# Altium project HeartRate_SpO2_Monitor.PrjPcb
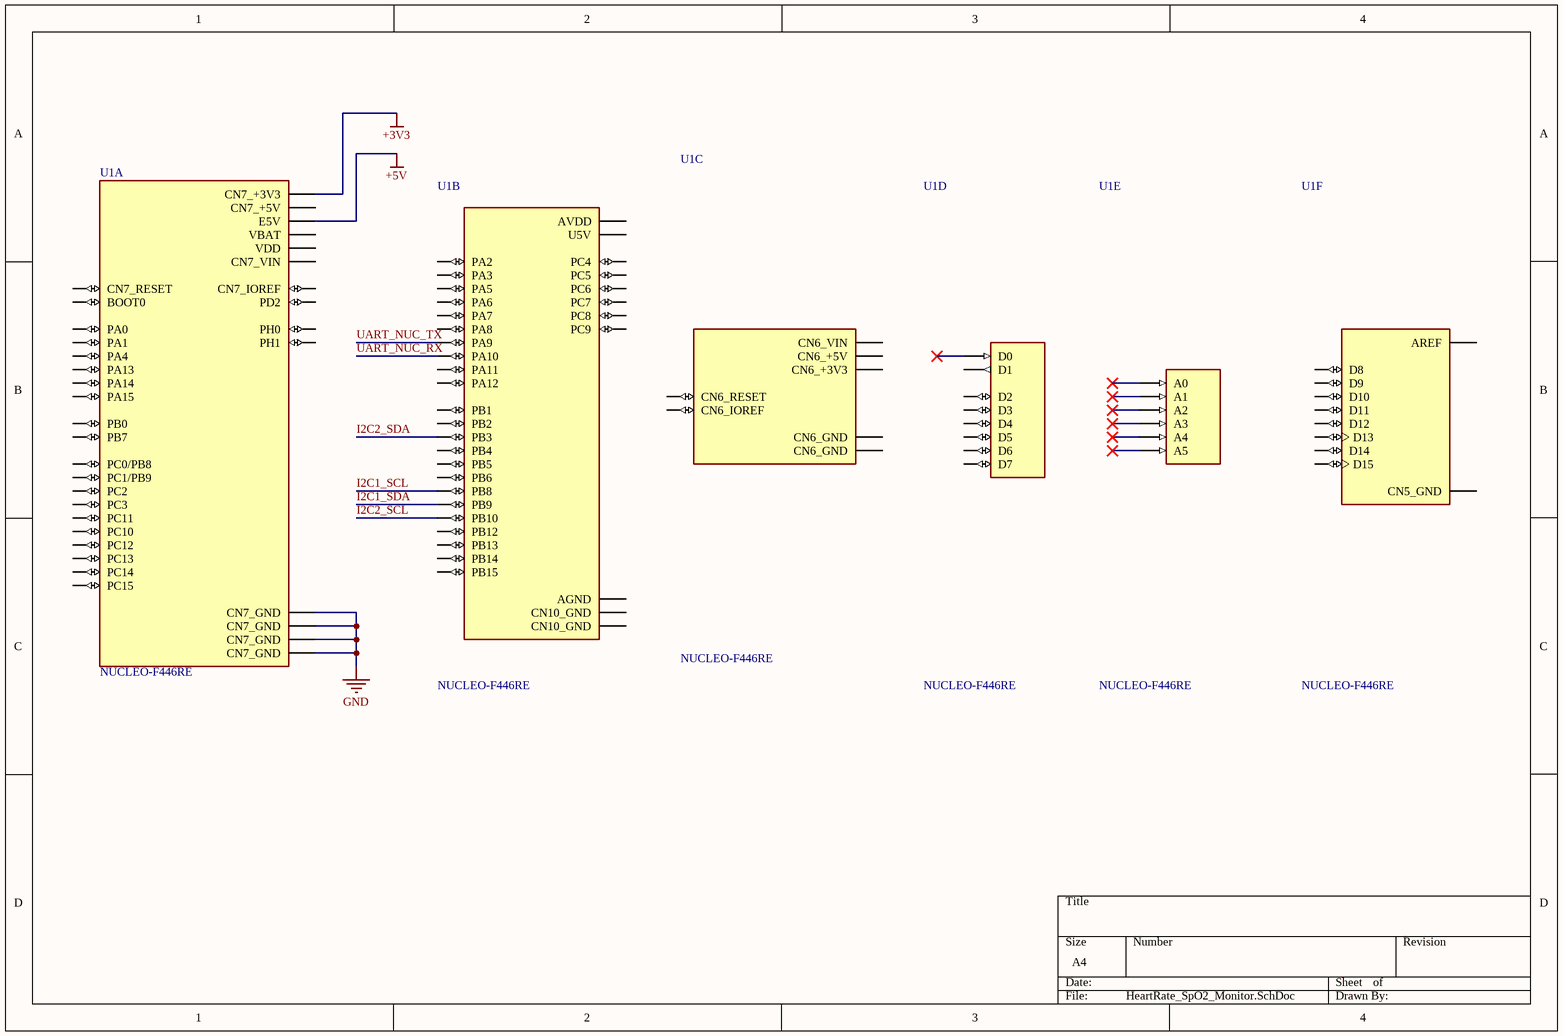
[diagram p0: HeartRate_SpO2_Monitor.SchDoc]
3 sheets, 21 parts. Net scope: global (net labels, ports and power ports of the same name join across sheets).
Board file: Pulsometro.PcbDoc
Sheets:
  HeartRate_SpO2_Monitor.SchDoc
  Alimentacion_Modulos.SchDoc
  Power.SchDoc

## Sheet HeartRate_SpO2_Monitor.SchDoc
size A4; SheetNumber: 1; SheetTotal: 2

### Parts
U1  NUCLEO-F446RE  [MODULE_NUCLEO-F446RE]  (parts A,B,C,D,E,F of 6)

### Nets
+3V3: U1.CN7_16(CN7_+3V3)
+5V: U1.CN7_6(E5V)
GND: U1.CN7_8(CN7_GND) U1.CN7_19(CN7_GND) U1.CN7_20(CN7_GND) U1.CN7_22(CN7_GND)
I2C1_SCL: U1.CN10_3(PB8)
I2C1_SDA: U1.CN10_5(PB9)
I2C2_SCL: U1.CN10_25(PB10)
I2C2_SDA: U1.CN10_31(PB3)
UART_NUC_RX: U1.CN10_33(PA10)
UART_NUC_TX: U1.CN10_21(PA9)

Not connected (* = marked no-connect by the designer): U1 CN5_1(D8) CN5_2(D9) CN5_3(D10) CN5_4(D11) CN5_5(D12) CN5_6(D13) CN5_7(CN5_GND) CN5_8(AREF) CN5_9(D14) CN5_10(D15) CN6_2(CN6_IOREF) CN6_3(CN6_RESET) CN6_4(CN6_+3V3) CN6_5(CN6_+5V) CN6_6(CN6_GND) CN6_7(CN6_GND) CN6_8(CN6_VIN) CN7_1(PC10) CN7_2(PC11) CN7_3(PC12) CN7_4(PD2) CN7_5(VDD) CN7_7(BOOT0) CN7_12(CN7_IOREF) CN7_13(PA13) CN7_14(CN7_RESET) CN7_15(PA14) CN7_17(PA15) CN7_18(CN7_+5V) CN7_21(PB7) CN7_23(PC13) CN7_24(CN7_VIN) CN7_25(PC14) CN7_27(PC15) CN7_28(PA0) CN7_29(PH0) CN7_30(PA1) CN7_31(PH1) CN7_32(PA4) CN7_33(VBAT) CN7_34(PB0) CN7_35(PC2) CN7_36(PC1/PB9) CN7_37(PC3) CN7_38(PC0/PB8) CN8_1(A0)* CN8_2(A1)* CN8_3(A2)* CN8_4(A3)* CN8_5(A4)* CN8_6(A5)* CN9_1(D0)* CN9_2(D1) CN9_3(D2) CN9_4(D3) CN9_5(D4) CN9_6(D5) CN9_7(D6) CN9_8(D7) CN10_1(PC9) CN10_2(PC8) CN10_4(PC6) CN10_6(PC5) CN10_7(AVDD) CN10_8(U5V) CN10_9(CN10_GND) CN10_11(PA5) CN10_12(PA12) CN10_13(PA6) CN10_14(PA11) CN10_15(PA7) CN10_16(PB12) CN10_17(PB6) CN10_19(PC7) CN10_20(CN10_GND) CN10_22(PB2) CN10_23(PA8) CN10_24(PB1) CN10_26(PB15) CN10_27(PB4) CN10_28(PB14) CN10_29(PB5) CN10_30(PB13) CN10_32(AGND) CN10_34(PC4) CN10_35(PA2) CN10_37(PA3)

### Library data of the parts
U1 = NUCLEO-F446RE: STM32F446RE, mbed-Enabled Development Nucleo-64 STM32F4 ARMÂ® CortexÂ®-M4 MCU 32-Bit Embedded Evaluation Board; MF: STMicroelectronics; SnapEDA_Link: https://www.snapeda.com/parts/NUCLEO-F446RE/STMicroelectronics/view-part/?ref=snap; Package: None; Value: *; MP: NUCLEO-F446RE; Check_prices: https://www.snapeda.com/parts/NUCLEO-F446RE/STMicroelectronics/view-part/?ref=eda

## Sheet Alimentacion_Modulos.SchDoc
size A4; SheetNumber: 2; SheetTotal: 3
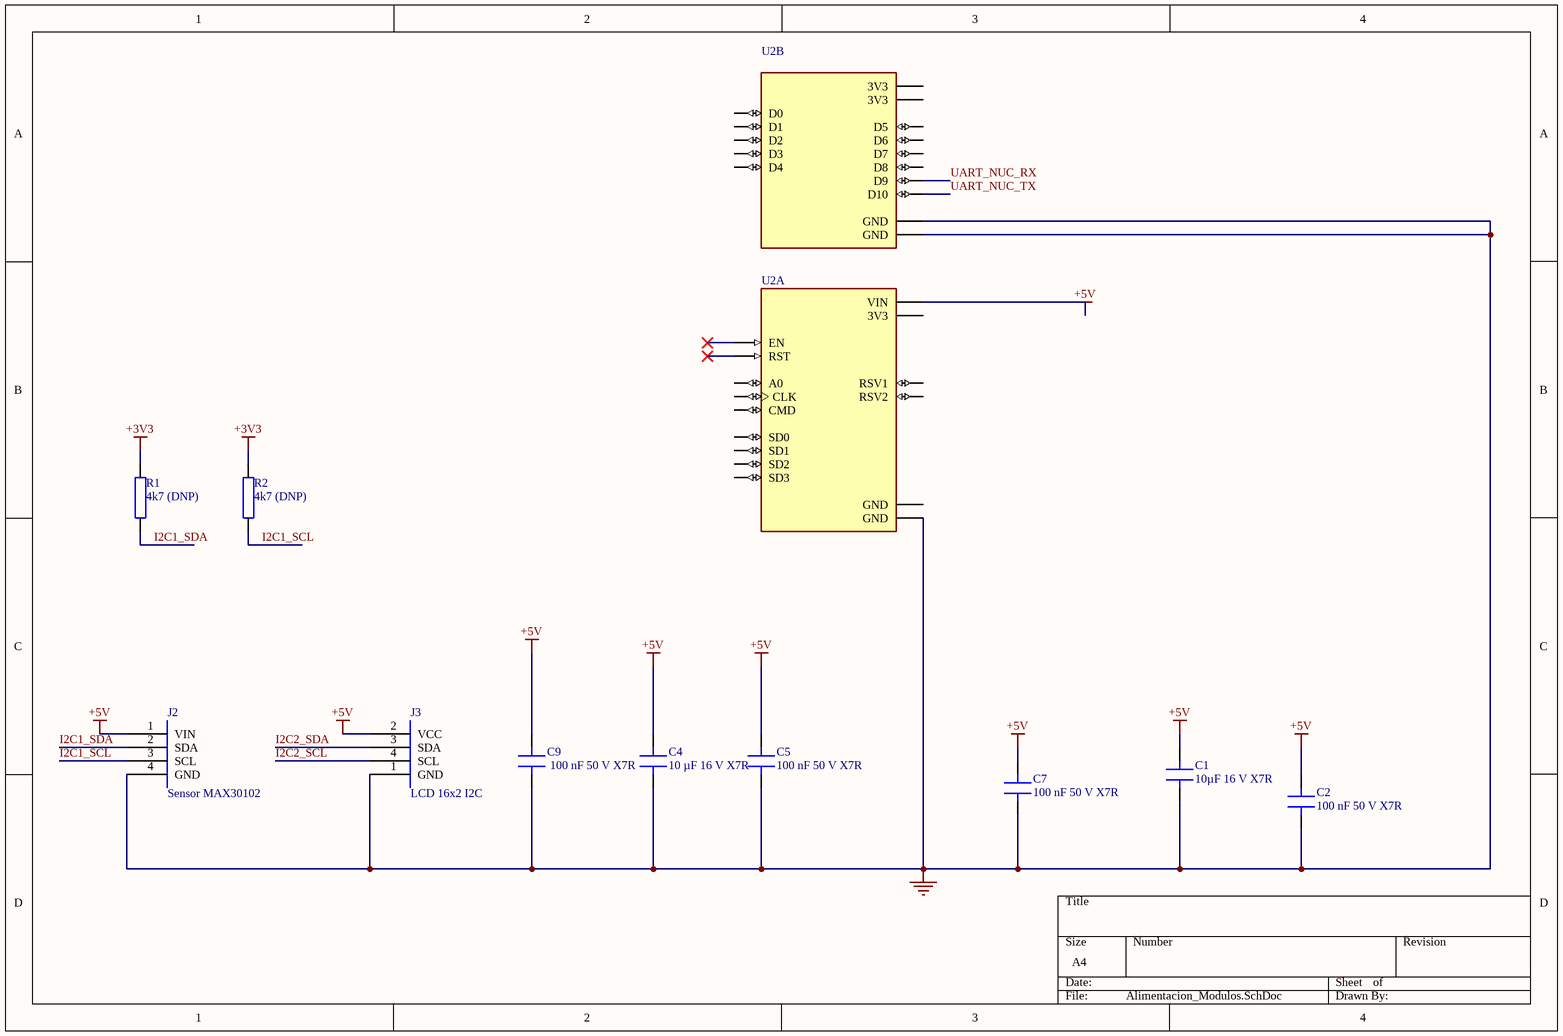
[diagram p1: Alimentacion_Modulos.SchDoc]

### Parts
C1  10µF 16 V X7R  [C0805]
C2  100 nF 50 V X7R  [C0805]
C4  10 µF 16 V X7R  [C0805]
C5  100 nF 50 V X7R  [C0805]
C7  100 nF 50 V X7R  [C0805]
C9  100 nF 50 V X7R  [C0805]
J2  Sensor MAX30102  [CONN_1x4_2.54]
J3  LCD 16x2 I2C  [CONN_1x4_2.54]
R1  4k7 (DNP)  [RES_AXIAL_P400]
R2  4k7 (DNP)  [RES_AXIAL_P400]
U2  (no value)  [SEEED_113990105]  (parts A,B of 2)

### Nets
+3V3: R1.2 R2.2
+5V: C1.1 C2.1 C4.1 C5.1 C7.1 C9.1 J2.1(VIN) J3.2(VCC) U2.J1_15(VIN)
GND: C1.2 C2.2 C4.2 C5.2 C7.2 C9.2 J2.4(GND) J3.1(GND) U2.J1_14(GND) U2.J2_7(GND) U2.J2_14(GND)
I2C1_SCL: J2.3(SCL) R2.1
I2C1_SDA: J2.2(SDA) R1.1
I2C2_SCL: J3.4(SCL)
I2C2_SDA: J3.3(SDA)
UART_NUC_RX: U2.J2_12(D9)
UART_NUC_TX: U2.J2_13(D10)

Not connected (* = marked no-connect by the designer): U2 J1_1(A0) J1_2(RSV1) J1_3(RSV2) J1_4(SD3) J1_5(SD2) J1_6(SD1) J1_7(CMD) J1_8(SD0) J1_9(CLK) J1_10(GND) J1_11(3V3) J1_12(EN)* J1_13(RST)* J2_1(D0) J2_2(D1) J2_3(D2) J2_4(D3) J2_5(D4) J2_6(3V3) J2_8(D5) J2_9(D6) J2_10(D7) J2_11(D8) J2_15(3V3)

### Library data of the parts
C1 C2 C4 C5 C7 C9 = Capacitor: Non polarized capacitor
J2 = CONN_SENSOR_MAX30102: Conector 1x4 para modulo MAX30102 (VIN SDA SCL GND)
J3 = CONN_LCD_I2C: Conector 1x4 para LCD 16x2 con backpack I2C (GND VCC SDA SCL)
R1 R2 = RES: Resistencia
U2 = 113990105: An open-source firmware and development kit that helps you to Prototype your IOT product within a few Lua script lines; MF: Seeed Technology; MP: NodeMCU v2; SnapEDA_Link: https://www.snapeda.com/parts/NodeMCU%20v2/Seeed+Technology+Co.%252C+Ltd/view-part/?ref=snap; Package: None; Value: *; Check_prices: https://www.snapeda.com/parts/NodeMCU%20v2/Seeed+Technology+Co.%252C+Ltd/view-part/?ref=eda

## Sheet Power.SchDoc
size A4; SheetNumber: 3; SheetTotal: 3
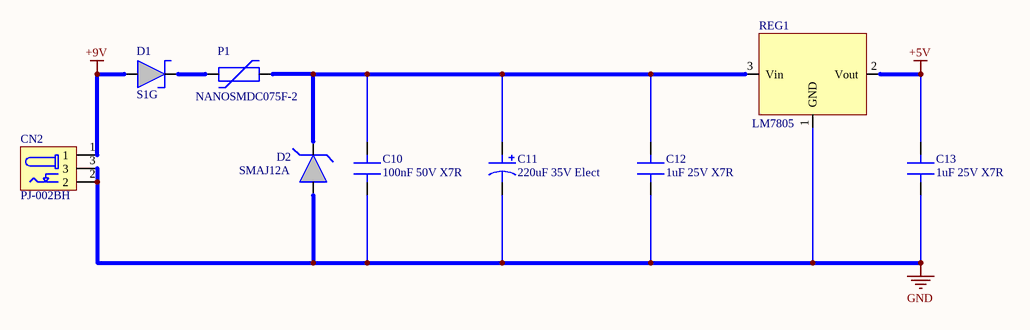
[diagram p2: Power.SchDoc]

### Parts
C10  100nF 50V X7R  [C0805]
C11  220uF 35V Elect  [Capacitor radial 8x11.5]
C12  1uF 25V X7R  [C0805]
C13  1uF 25V X7R  [C0805]
CN2  PJ-002BH  [PJ-002BH]
D1  S1G  [SMA (DO-214AC)]
D2  SMAJ12A  [SMA (DO-214AC)]
P1  NANOSMDC075F-2  [NANOSMDC016F]
REG1  LM7805  [SOT 223]

### Nets
+5V: C13.1 REG1.2(Vout)
+9V: CN2.1 D1.1
GND: C10.2 C11.2 C12.2 C13.2 CN2.2 CN2.3 D2.1 REG1.1(GND)
NetC10_1: C10.1 C11.1 C12.1 D2.2 P1.2 REG1.3(Vin)
NetD1_2: D1.2 P1.1

### Library data of the parts
C10 C12 C13 = Capacitor: Non polarized capacitor
C11 = Polarized Capacitor
CN2 = Power Jack: 3 pins jack
D1 = Schottky Diode
D2 = TVS: Transient voltage suppression diode
P1 = Polyswitch
REG1 = LM78xx: Voltage regulator

## Nets that join several sheets
+3V3: HeartRate_SpO2_Monitor (U1.CN7_16), Alimentacion_Modulos (R1.2 R2.2)
+5V: HeartRate_SpO2_Monitor (U1.CN7_6), Alimentacion_Modulos (9 pins), Power (C13.1 REG1.2)
GND: HeartRate_SpO2_Monitor (U1.CN7_8 U1.CN7_19 U1.CN7_20 U1.CN7_22), Alimentacion_Modulos (11 pins), Power (8 pins)
I2C1_SCL: HeartRate_SpO2_Monitor (U1.CN10_3), Alimentacion_Modulos (J2.3 R2.1)
I2C1_SDA: HeartRate_SpO2_Monitor (U1.CN10_5), Alimentacion_Modulos (J2.2 R1.1)
I2C2_SCL: HeartRate_SpO2_Monitor (U1.CN10_25), Alimentacion_Modulos (J3.4)
I2C2_SDA: HeartRate_SpO2_Monitor (U1.CN10_31), Alimentacion_Modulos (J3.3)
UART_NUC_RX: HeartRate_SpO2_Monitor (U1.CN10_33), Alimentacion_Modulos (U2.J2_12)
UART_NUC_TX: HeartRate_SpO2_Monitor (U1.CN10_21), Alimentacion_Modulos (U2.J2_13)